# Altium schematic sheet B_Top.SchDoc
size A4; SheetNumber: 1; SheetTotal: 6
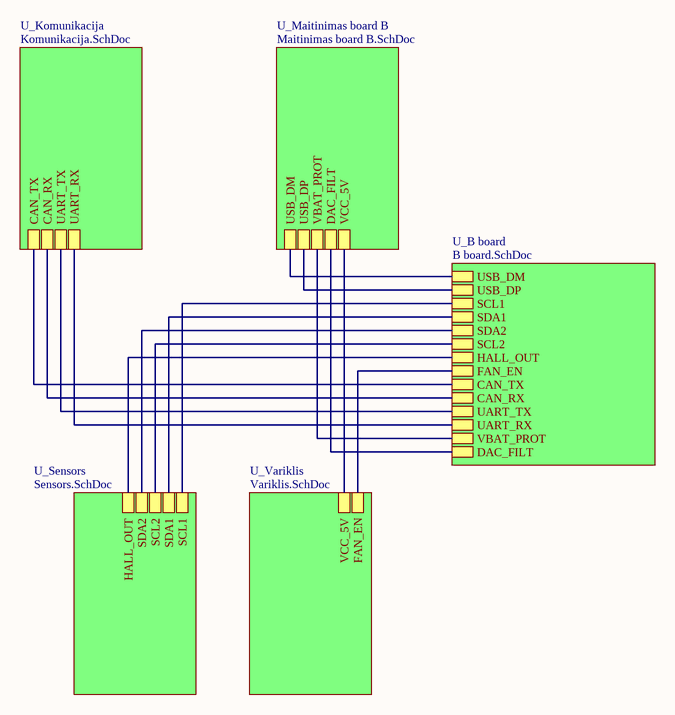
[diagram p0: B_Top.SchDoc]

## Sub-sheets
U_B board = B board.SchDoc: USB_DM, USB_DP, SCL1, SDA1, SDA2, SCL2, HALL_OUT, FAN_EN, CAN_TX, CAN_RX, UART_TX, UART_RX, VBAT_PROT, DAC_FILT
U_Komunikacija = Komunikacija.SchDoc: CAN_TX, CAN_RX, UART_TX, UART_RX
U_Maitinimas board B = Maitinimas board B.SchDoc: USB_DM, USB_DP, VBAT_PROT, DAC_FILT, VCC_5V
U_Sensors = Sensors.SchDoc: SCL1, SDA1, SCL2, SDA2, HALL_OUT
U_Variklis = Variklis.SchDoc: FAN_EN, VCC_5V

## Nets
(unnamed): sheet U_B board/USB_DM, sheet U_Maitinimas board B/USB_DM
(unnamed): sheet U_B board/USB_DP, sheet U_Maitinimas board B/USB_DP
(unnamed): sheet U_B board/SCL1, sheet U_Sensors/SCL1
(unnamed): sheet U_B board/SDA1, sheet U_Sensors/SDA1
(unnamed): sheet U_B board/SDA2, sheet U_Sensors/SDA2
(unnamed): sheet U_B board/SCL2, sheet U_Sensors/SCL2
(unnamed): sheet U_B board/HALL_OUT, sheet U_Sensors/HALL_OUT
(unnamed): sheet U_B board/FAN_EN, sheet U_Variklis/FAN_EN
(unnamed): sheet U_B board/CAN_TX, sheet U_Komunikacija/CAN_TX
(unnamed): sheet U_B board/CAN_RX, sheet U_Komunikacija/CAN_RX
(unnamed): sheet U_B board/UART_TX, sheet U_Komunikacija/UART_TX
(unnamed): sheet U_B board/UART_RX, sheet U_Komunikacija/UART_RX
(unnamed): sheet U_B board/VBAT_PROT, sheet U_Maitinimas board B/VBAT_PROT
(unnamed): sheet U_B board/DAC_FILT, sheet U_Maitinimas board B/DAC_FILT
(unnamed): sheet U_Maitinimas board B/VCC_5V, sheet U_Variklis/VCC_5V